# Altium schematic sheet Flashing.SchDoc
size A4; SheetNumber: 3; SheetTotal: 4
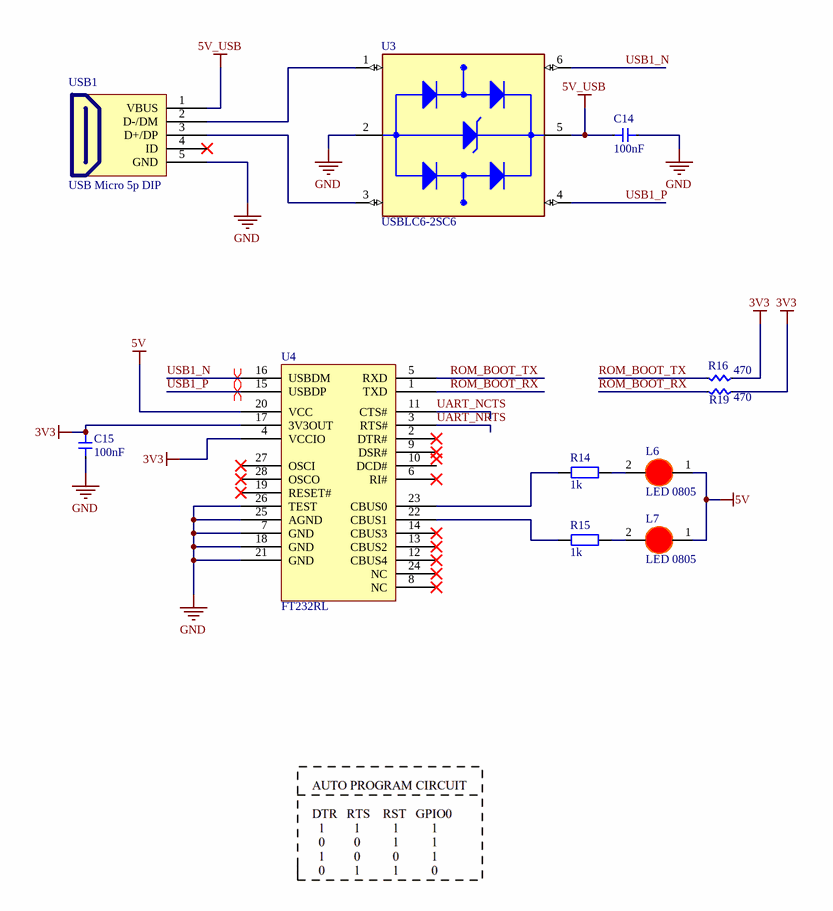
[diagram p0: Flashing.SchDoc]

## Parts
C14  100nF  [Cap 0805]
C15  100nF  [Cap 0805]
L6  LED 0805  [LED-0805-Red]
L7  LED 0805  [LED-0805-Red]
R14  1k  [RES-SMD-0805]
R15  1k  [RES-SMD-0805]
R16  470  [RES 0805]
R19  470  [RES 0805]
U3  USBLC6-2SC6  [SOT95P280X145-6N]
U4  FT232RL  [TSSOP28_25.5_295_15X58_SMD]
USB1  USB Micro 5p DIP  [USB Micro 5p DIP]

## Nets
3V3: C15.2 R16.1 R19.1 U4.4(VCCIO) U4.17(3V3OUT)
5V: L6.1(A) L7.1(A) U4.20(VCC)
5V_USB: C14.1 U3.5(VBUS) USB1.1(VBUS)
GND: C14.2 C15.1 U3.2(GND) U4.7(GND) U4.18(GND) U4.21(GND) U4.25(AGND) U4.26(TEST) USB1.5(GND)
ROM_BOOT_RX: R19.2 U4.1(TXD)
ROM_BOOT_TX: R16.2 U4.5(RXD)
UART_NCTS: U4.11(CTS#)
UART_NRTS: U4.3(RTS#)
USB1_N: U3.6(I/O1_OUT) U4.16(USBDM)
USB1_P: U3.4(I/O2_OUT) U4.15(USBDP)
NetL6_2: L6.2(K) R14.2
NetL7_2: L7.2(K) R15.2
NetR14_1: R14.1 U4.23(CBUS0)
NetR15_1: R15.1 U4.22(CBUS1)
NetU3_1: U3.1(I/O1_IN) USB1.2(D-/DM)
NetU3_3: U3.3(I/O2_IN) USB1.3(D+/DP)

Not connected (* = marked no-connect by the designer): U4 2(DTR#)* 6(RI#)* 8(NC)* 9(DSR#)* 10(DCD#) 12(CBUS4)* 13(CBUS2)* 14(CBUS3)* 19(RESET#)* 24(NC)* 27(OSCI)* 28(OSCO)*; USB1 4(ID)*

## Layout directives
differential pair: USB1_N, USB1_P

## Notes on the sheet
- Title
- Size:
- Date:
- Author:
- CC2538 DEVELOPMENT KIT
- A4
- Phan Chuong
- Time:
- Number:
- Checked:
- Revision:
- Sheet
- Draw by
- of
- DATN

## Library data of the parts
C14 C15 = Cap 0805: Capacitor SMD 0805
L6 L7 = LED 0805 Do: Dán; Don_Vi: Con; Ma_Hang: MH000897; Ten_Linh_Kien: LED 0805 Màu Đỏ (Red); Ghi_Chu: *; Kieu_Chan: *; Chung_Loai: Dán
R14 R15 = R: Resistor R1/4W
R16 R19 = RES 0805: RES SMD 0805; Manufacturer: Vishay Dale; Manufacturer Part Number: CRCW040210K0FKED; Resistance (Ohms): 10k; Tolerance: ±1%; Power (Watts): 0.063W, 1/16W; Temperature Coefficient: ±100ppm/°C; Supplier 1: Digi-Key; RoHS: RoHS Compliant; Category: Resistors; Stock 1: 2392462; Pricing 1: 10=0.083, 50=0.0444, 200=0.0255, 1000=0.0174 (USD); Packaging: Cut Tape (CT); Composition: Thick Film; Features: Automotive AEC-Q200; Operating Temperature: -55°C ~ 155°C; Package / Case: 0402 (1005 Metric); Supplier Device Package: 0402 (1005 Metric); Size / Dimension: 0.039" L x 0.020" W (1.00mm x 0.50mm); Height: 0.016" (0.40mm); Number of Terminations: 2; ComponentLink1URL: http://www.vishay.com/docs/20035/dcrcwe3.pdf; ComponentLink1Description: http://www.vishay.com/docs/20035/dcrcwe3.pdf; Supplier Part Number 1: 541-10.0KLCT-ND
U3 = USBLC6-2SC6: 17V Clamp 5A (8/20Âµs) Ipp Tvs Diode Surface Mount SOT-23-6; MF: STMicroelectronics; Value: *; SnapEDA_Link: https://www.snapeda.com/parts/USBLC6-2SC6/STMicroelectronics/view-part/?ref=snap; Check_prices: https://www.snapeda.com/parts/USBLC6-2SC6/STMicroelectronics/view-part/?ref=eda; Purchase-URL: https://pricing.snapeda.com/search/part/USBLC6-2SC6/?ref=eda; Price: None; Availability: In Stock; Package: SOT-23-6 STMicroelectronics; MP: USBLC6-2SC6
U4 = IC_FT232RL: USB Bridge, USB to UART USB 2.0 UART Interface 28-SSOP; Manufacturer: FTDI; Alternate Part Number-1: NA; Manufacturer Part Number: FT232RL; Case/Package: TSSOP28; Supplier-1: Aliepress; Supplier Part Number-1: FT232RL
USB1 = USB Micro 5p DIP: USB Type B; Ten: MicroUSB MK5P DIP; Ma_Hang: MH005145